# Altium schematic sheet A_top.SchDoc
size A4; SheetNumber: 1; SheetTotal: 4
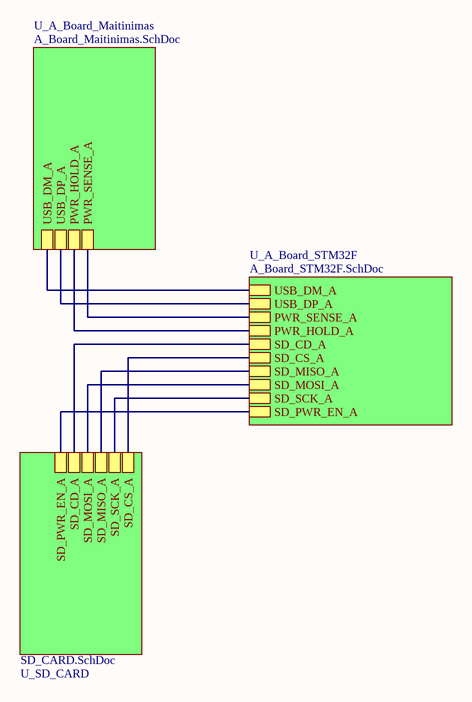
[diagram p0: A_top.SchDoc]

## Sub-sheets
U_A_Board_Maitinimas = A_Board_Maitinimas.SchDoc: USB_DM_A, USB_DP_A, PWR_HOLD_A, PWR_SENSE_A
U_A_Board_STM32F = A_Board_STM32F.SchDoc: USB_DM_A, USB_DP_A, PWR_SENSE_A, PWR_HOLD_A, SD_CD_A, SD_CS_A, SD_MISO_A, SD_MOSI_A, SD_SCK_A, SD_PWR_EN_A
U_SD_CARD = SD_CARD.SchDoc: SD_CS_A, SD_SCK_A, SD_MISO_A, SD_MOSI_A, SD_CD_A, SD_PWR_EN_A

## Nets
(unnamed): sheet U_A_Board_Maitinimas/USB_DM_A, sheet U_A_Board_STM32F/USB_DM_A
(unnamed): sheet U_A_Board_Maitinimas/USB_DP_A, sheet U_A_Board_STM32F/USB_DP_A
(unnamed): sheet U_A_Board_Maitinimas/PWR_HOLD_A, sheet U_A_Board_STM32F/PWR_HOLD_A
(unnamed): sheet U_A_Board_Maitinimas/PWR_SENSE_A, sheet U_A_Board_STM32F/PWR_SENSE_A
(unnamed): sheet U_A_Board_STM32F/SD_CD_A, sheet U_SD_CARD/SD_CD_A
(unnamed): sheet U_A_Board_STM32F/SD_CS_A, sheet U_SD_CARD/SD_CS_A
(unnamed): sheet U_A_Board_STM32F/SD_MISO_A, sheet U_SD_CARD/SD_MISO_A
(unnamed): sheet U_A_Board_STM32F/SD_MOSI_A, sheet U_SD_CARD/SD_MOSI_A
(unnamed): sheet U_A_Board_STM32F/SD_SCK_A, sheet U_SD_CARD/SD_SCK_A
(unnamed): sheet U_A_Board_STM32F/SD_PWR_EN_A, sheet U_SD_CARD/SD_PWR_EN_A